# Altium project HP-85_IO_Extender_V2_4_Layer.PrjPcb
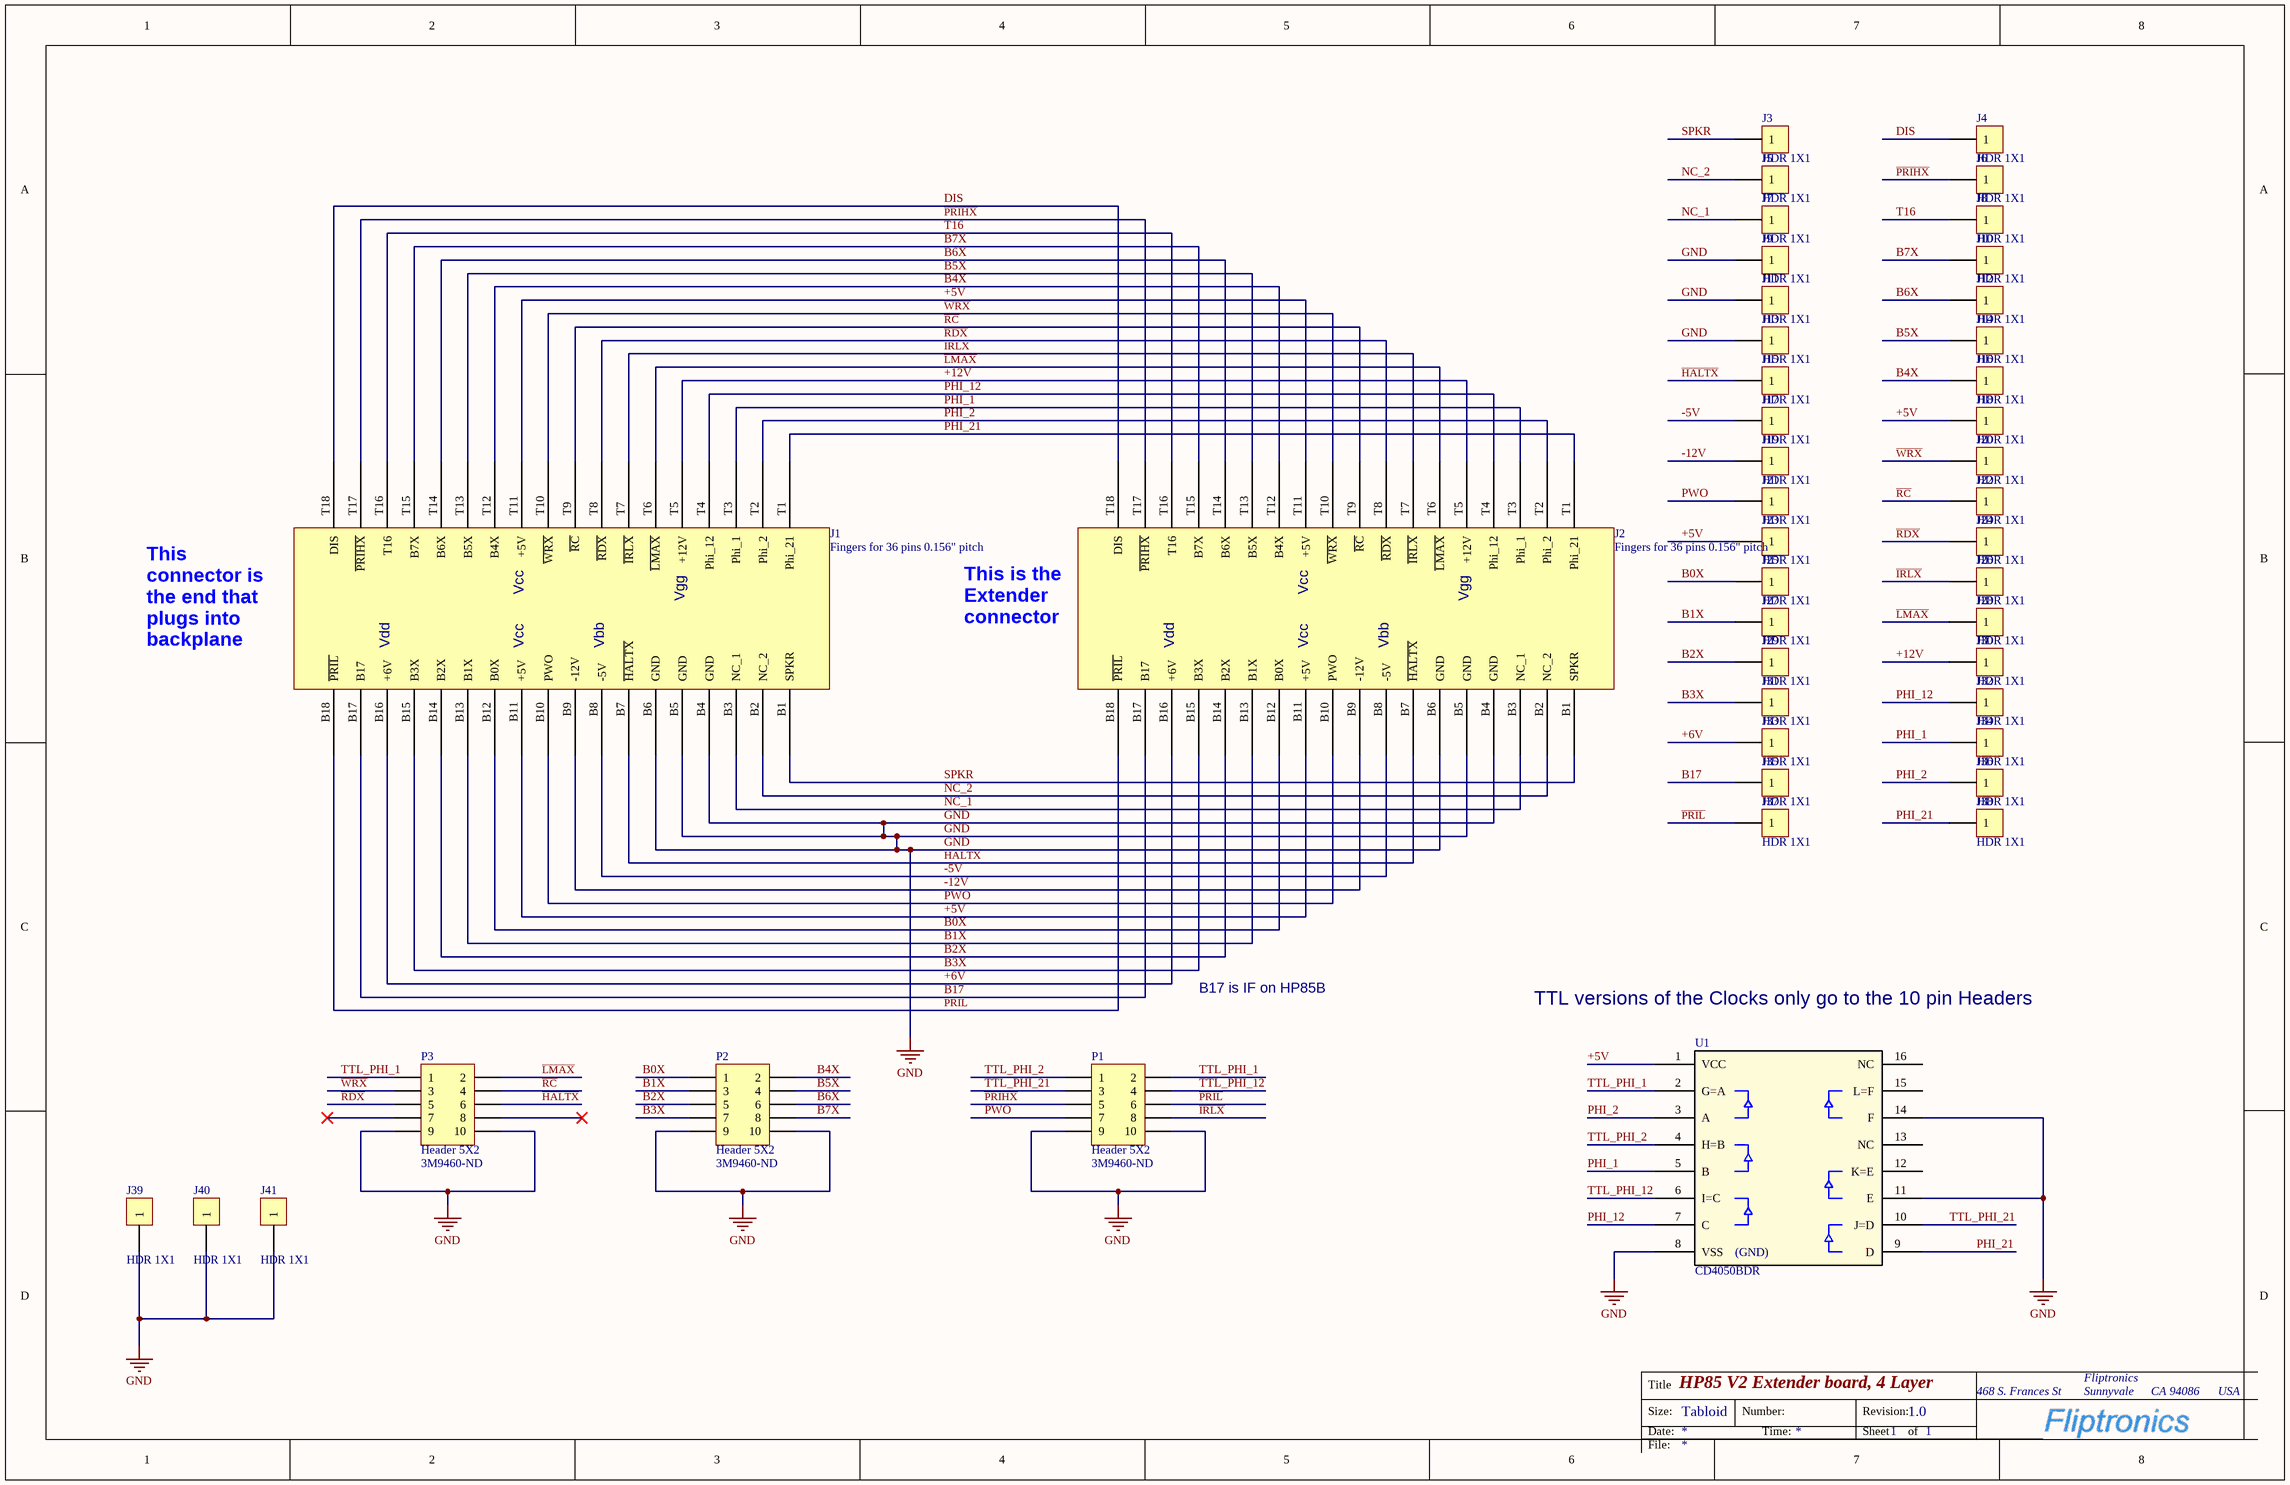
[diagram p0: HP-85_IO_Extender_V2_4_Layer.SchDoc]
1 sheet, 45 parts. Net scope: global (net labels, ports and power ports of the same name join across sheets).
Board file: HP-85_IO_Extender_V2_4_Layer.PcbDoc

## Sheet HP-85_IO_Extender_V2_4_Layer.SchDoc: HP85 V2 Extender board, 4 Layer
size Tabloid; ApprovedBy: Philip Freidin; CheckedBy: Philip Freidin; Author: Philip Freidin; Organization: Fliptronics; Address1: 468 S. Frances St; Address2: Sunnyvale; Address3: CA 94086; Address4: USA; Revision: 1.0; SheetNumber: 1; SheetTotal: 1

### Parts
J1  Fingers for 36 pins 0.156" pitch  [Fingers for 36 pins 0.156" pitch]
J2  Fingers for 36 pins 0.156" pitch  [Fingers for 36 pins 0.156" pitch]
J3  HDR 1X1  [HDR_1X1_2MM54_round]
J4  HDR 1X1  [HDR_1X1_2MM54_round]
J5  HDR 1X1  [HDR_1X1_2MM54_round]
J6  HDR 1X1  [HDR_1X1_2MM54_round]
J7  HDR 1X1  [HDR_1X1_2MM54_round]
J8  HDR 1X1  [HDR_1X1_2MM54_round]
J9  HDR 1X1  [HDR_1X1_2MM54_round]
J10  HDR 1X1  [HDR_1X1_2MM54_round]
J11  HDR 1X1  [HDR_1X1_2MM54_round]
J12  HDR 1X1  [HDR_1X1_2MM54_round]
J13  HDR 1X1  [HDR_1X1_2MM54_round]
J14  HDR 1X1  [HDR_1X1_2MM54_round]
J15  HDR 1X1  [HDR_1X1_2MM54_round]
J16  HDR 1X1  [HDR_1X1_2MM54_round]
J17  HDR 1X1  [HDR_1X1_2MM54_round]
J18  HDR 1X1  [HDR_1X1_2MM54_round]
J19  HDR 1X1  [HDR_1X1_2MM54_round]
J20  HDR 1X1  [HDR_1X1_2MM54_round]
J21  HDR 1X1  [HDR_1X1_2MM54_round]
J22  HDR 1X1  [HDR_1X1_2MM54_round]
J23  HDR 1X1  [HDR_1X1_2MM54_round]
J24  HDR 1X1  [HDR_1X1_2MM54_round]
J25  HDR 1X1  [HDR_1X1_2MM54_round]
J26  HDR 1X1  [HDR_1X1_2MM54_round]
J27  HDR 1X1  [HDR_1X1_2MM54_round]
J28  HDR 1X1  [HDR_1X1_2MM54_round]
J29  HDR 1X1  [HDR_1X1_2MM54_round]
J30  HDR 1X1  [HDR_1X1_2MM54_round]
J31  HDR 1X1  [HDR_1X1_2MM54_round]
J32  HDR 1X1  [HDR_1X1_2MM54_round]
J33  HDR 1X1  [HDR_1X1_2MM54_round]
J34  HDR 1X1  [HDR_1X1_2MM54_round]
J35  HDR 1X1  [HDR_1X1_2MM54_round]
J36  HDR 1X1  [HDR_1X1_2MM54_round]
J37  HDR 1X1  [HDR_1X1_2MM54_round]
J38  HDR 1X1  [HDR_1X1_2MM54_round]
J39  HDR 1X1  [HDR_1X1_2MM54_round]
J40  HDR 1X1  [HDR_1X1_2MM54_round]
J41  HDR 1X1  [HDR_1X1_2MM54_round]
P1  Header 5X2  Supplier Part Number 1: 3M9460-ND  [HDR_5X2 alt 1]
P2  Header 5X2  Supplier Part Number 1: 3M9460-ND  [HDR_5X2 alt 1]
P3  Header 5X2  Supplier Part Number 1: 3M9460-ND  [HDR_5X2 alt 1]
U1  CD4050BDR  [SOIC 16 W3.9mm P1.27mm]

### Nets
GND: J1.B4(GND) J1.B5(GND) J1.B6(GND) J2.B4(GND) J2.B5(GND) J2.B6(GND) J9.1 J11.1 J13.1 J39.1 J40.1 J41.1 P1.9 P1.10 P2.9 P2.10 P3.9 P3.10 U1.8(VSS) U1.11(E) U1.14(F)
+5V: J1.B11(+5V) J1.T11(+5V) J2.B11(+5V) J2.T11(+5V) J18.1 J23.1 U1.1(VCC)
+6V: J1.B16(+6V) J2.B16(+6V) J33.1
+12V: J1.T5(+12V) J2.T5(+12V) J30.1
-5V: J1.B8(-5V) J2.B8(-5V) J17.1
-12V: J1.B9(-12V) J2.B9(-12V) J19.1
~{HALTX}: J1.B7(~{HALTX}) J2.B7(~{HALTX}) J15.1 P3.6
~{IRLX}: J1.T7(~{IRLX}) J2.T7(~{IRLX}) J26.1 P1.8
~{LMAX}: J1.T6(~{LMAX}) J2.T6(~{LMAX}) J28.1 P3.2
~{PRIHX}: J1.T17(~{PRIHX}) J2.T17(~{PRIHX}) J6.1 P1.5
~{PRIL}: J1.B18(~{PRIL}) J2.B18(~{PRIL}) J37.1 P1.6
~{RC}: J1.T9(~{RC}) J2.T9(~{RC}) J22.1 P3.4
~{RDX}: J1.T8(~{RDX}) J2.T8(~{RDX}) J24.1 P3.5
~{WRX}: J1.T10(~{WRX}) J2.T10(~{WRX}) J20.1 P3.3
B0X: J1.B12(B0X) J2.B12(B0X) J25.1 P2.1
B1X: J1.B13(B1X) J2.B13(B1X) J27.1 P2.3
B2X: J1.B14(B2X) J2.B14(B2X) J29.1 P2.5
B3X: J1.B15(B3X) J2.B15(B3X) J31.1 P2.7
B4X: J1.T12(B4X) J2.T12(B4X) J16.1 P2.2
B5X: J1.T13(B5X) J2.T13(B5X) J14.1 P2.4
B6X: J1.T14(B6X) J2.T14(B6X) J12.1 P2.6
B7X: J1.T15(B7X) J2.T15(B7X) J10.1 P2.8
B17: J1.B17 J2.B17 J35.1
DIS: J1.T18(DIS) J2.T18(DIS) J4.1
NC_1: J1.B3(NC_1) J2.B3(NC_1) J7.1
NC_2: J1.B2(NC_2) J2.B2(NC_2) J5.1
PHI_1: J1.T3(Phi_1) J2.T3(Phi_1) J34.1 U1.5(B)
PHI_2: J1.T2(Phi_2) J2.T2(Phi_2) J36.1 U1.3(A)
PHI_12: J1.T4(Phi_12) J2.T4(Phi_12) J32.1 U1.7(C)
PHI_21: J1.T1(Phi_21) J2.T1(Phi_21) J38.1 U1.9(D)
PWO: J1.B10(PWO) J2.B10(PWO) J21.1 P1.7
SPKR: J1.B1(SPKR) J2.B1(SPKR) J3.1
T16: J1.T16 J2.T16 J8.1
TTL_PHI_1: P1.2 P3.1 U1.2(G=A)
TTL_PHI_2: P1.1 U1.4(H=B)
TTL_PHI_12: P1.4 U1.6(I=C)
TTL_PHI_21: P1.3 U1.10(J=D)

Not connected (* = marked no-connect by the designer): P3 7* 8*; U1 12(K=E) 13(NC) 15(L=F) 16(NC)

### Notes on the sheet
- This connector is the end that plugs into backplane
- (near J2) This is the  Extender connector
- B17 is IF on HP85B
- TTL versions of the Clocks only go to the 10 pin Headers
- Title
- Size:
- Date:
- Tabloid
- Number:
- Time:
- Revision:
- Sheet
- of
- File:
- (in symbol J Fingers for 36 pins 0.156" pitch for HP85) Vcc; Vgg; Vdd; Vbb
- (in symbol U CD4050BDR) (GND)

### Library data of the parts
J1 J2 = J Fingers for 36 pins 0.156" pitch for HP85: Fingers for 36 pins 0.156" pitch for HP85
J3-J41 = J Header 1X1: Header, 1-Pin; 1 MANUFACTURE A: Fliptronics; 1 MANUFACTURE A WEBSITE: ~; LatestRevisionDate: 2/11/2011; LatestRevisionNote: Created by PMF; Publisher: Fliptronics; 1 DISTRIBUTOR A: Fliptronics; 1 DISTRIBUTOR A ordering number: Philips Parts bin; 1 DISTRIBUTOR A price 1 off: 0.01; 1 DISTRIBUTOR A price 100 off: 0.01; 1 MANUFACTURE A PART NUMBER: Header 1X1; Supplier 1: Fliptronics; Supplier Part Number 1: Header 1X1; Supplier Stock 1: 20; Supplier Unit Price 1: 0.01
P1-P3 = J Header 5X2: Header, 5-Pin, Dual row; 1 MANUFACTURE A WEBSITE: ~; LatestRevisionDate: 17-Jul-2002; LatestRevisionNote: Re-released for DXP Platform.; Publisher: Altium Limited; Supplier 1: Digi-Key; 1 DISTRIBUTOR A: Digi-Key; 1 DISTRIBUTOR A ordering number: 3M9460-ND; 1 DISTRIBUTOR A price 1 off: 0.46; 1 DISTRIBUTOR A price 100 off: 0.336
U1 = U CD4050BDR: 48mA 1 3V~18V 8mA 6 SOP-16 Buffer/Driver/Transceiver ROHS; Manufacturer: Texas Instruments; Manufacturer Lifecycle Status: ACTIVE; High Level Output Current: -5.2mA; Logic Function: Buffer; Max Supply Voltage: 20V; Min Supply Voltage: -500mV; Number of Bits: 6; Number of Bits per Element: 1; Polarity: Non-Inverting; Propagation Delay: 60ns; Quiescent Current: 20µA; Turn-On Delay Time: 140ns; Supplier 1: DigiKey; Manufacturer Part Number: CD4050BDR; RoHS: Compliant; Category: Buffers, Drivers and Transceivers; Stock 1: 14885; Pricing 1: 1=0.65, 10=0.463, 25=0.4148, 100=0.3619, 250=0.33672, 500=0.32152, 1000=0.31463 (USD); Case/Package: SOIC; Contact Plating: Gold; Height: 1.75mm; Lead Free: Lead Free; Length: 9.9mm; Lifecycle Status: Production; Low Level Output Current: 8mA; Max Operating Temperature: 125°C; Min Operating Temperature: -55°C; Mount: Surface Mount; Number of Channels: 6; Number of Elements: 6; Number of Input Lines: 6; Number of Inputs: 6; Number of Output Lines: 6; Number of Outputs: 6; Number of Pins: 16; REACH SVHC: No; Schedule B: 8542390000, 8542390000|8542390000, 8542390000|8542390000|8542390000, 8542390000|8542390000|8542390000|8542390000; Thickness: 1.58mm; Width: 3.91mm; ComponentLink1URL: https://datasheet.octopart.com:443/CD4050BDR-Texas-Instruments-datasheet-27203525.pdf?src-supplier=Texas+Instruments; ComponentLink1Description: https://datasheet.octopart.com:443/CD4050BDR-Texas-Instruments-datasheet-27203525.pdf?src-supplier=Texas+Instruments; ComponentLink2URL: https://octopart.com:443/opatz8j6/c1?t=shVpaK6kaZhAvTquMlP1kBmJufYCgjIb7Ueuvqz-PnQIGf9tBCA2wmVZVeSwyNL0wzyf1zJ6cCOTEOJQq0X9BE7WZFlE6C07Lu1yrPRH_7pU960K83zF6yinbbCHbFuD_5RPOvEgQG4NC-UyO4eI_-JLm9EqoVbgrPpU-OW4hF6S15oXQIfFl2K9w9uWlKjIYejht7RtKTQToVbOn7eFDvn1ewvRfpT4TuhUbb8n15bolN7mi033KwD5LlF8ls95dB4PEoMTxflP_fiLEga3HBAg6_F-FWLajFotRU9aIDiCdH1EM8mIYNgu9aan6gZA_nC7nOERzDGX5uTal7J7VcnLExSN8lvBAblD4E7X5ipqS6VayOPvGHdeXsXJXIgW7ksw&src-supplier=Texas+Instruments; ComponentLink2Description: https://octopart.com:443/opatz8j6/c1?t=shVpaK6kaZhAvTquMlP1kBmJufYCgjIb7Ueuvqz-PnQIGf9tBCA2wmVZVeSwyNL0wzyf1zJ6cCOTEOJQq0X9BE7WZFlE6C07Lu1yrPRH_7pU960K83zF6yinbbCHbFuD_5RPOvEgQG4NC-UyO4eI_-JLm9EqoVbgrPpU-OW4hF6S15oXQIfFl2K9w9uWlKjIYejht7RtKTQToVbOn7eFDvn1ewvRfpT4TuhUbb8n15bolN7mi033KwD5LlF8ls95dB4PEoMTxflP_fiLEga3HBAg6_F-FWLajFotRU9aIDiCdH1EM8mIYNgu9aan6gZA_nC7nOERzDGX5uTal7J7VcnLExSN8lvBAblD4E7X5ipqS6VayOPvGHdeXsXJXIgW7ksw&src-supplier=Texas+Instruments; ComponentLink3URL: https://datasheet.octopart.com:443/CD4050BDR-Texas-Instruments-datasheet-10770490.pdf?src-supplier=Texas+Instruments; ComponentLink3Description: https://datasheet.octopart.com:443/CD4050BDR-Texas-Instruments-datasheet-10770490.pdf?src-supplier=Texas+Instruments; ComponentLink4URL: https://datasheet.octopart.com:443/CD4050BDR-Texas-Instruments-datasheet-10254678.pdf?src-supplier=Texas+Instruments; ComponentLink4Description: https://datasheet.octopart.com:443/CD4050BDR-Texas-Instruments-datasheet-10254678.pdf?src-supplier=Texas+Instruments; ComponentLink5URL: https://sigma.octopart.com:443/49249801/technical_drawing/Texas-Instruments-CD4050BDR.pdf?src-supplier=Texas+Instruments; ComponentLink5Description: https://sigma.octopart.com:443/49249801/technical_drawing/Texas-Instruments-CD4050BDR.pdf?src-supplier=Texas+Instruments; ComponentLink6URL: https://datasheet.octopart.com:443/CD4050BDR-Texas-Instruments-datasheet-148518.pdf?src-supplier=Texas+Instruments; ComponentLink6Description: https://datasheet.octopart.com:443/CD4050BDR-Texas-Instruments-datasheet-148518.pdf?src-supplier=Texas+Instruments; ComponentLink7URL: https://datasheet.octopart.com:443/CD4050BDR-Texas-Instruments-datasheet-10253518.pdf?src-supplier=Texas+Instruments; ComponentLink7Description: https://datasheet.octopart.com:443/CD4050BDR-Texas-Instruments-datasheet-10253518.pdf?src-supplier=Texas+Instruments; ComponentLink8URL: https://datasheet.octopart.com:443/CD4050BDR-Texas-Instruments-datasheet-47642703.pdf?src-supplier=Newark; ComponentLink8Description: https://datasheet.octopart.com:443/CD4050BDR-Texas-Instruments-datasheet-47642703.pdf?src-supplier=Newark; ComponentLink9URL: https://datasheet.octopart.com:443/CD4050BDR-Texas-Instruments-datasheet-21412919.pdf?src-supplier=Newark; ComponentLink9Description: https://datasheet.octopart.com:443/CD4050BDR-Texas-Instruments-datasheet-21412919.pdf?src-supplier=Newark; ComponentLink10URL: https://datasheet.octopart.com:443/CD4050BDR-Texas-Instruments-datasheet-11534345.pdf?src-supplier=Newark; ComponentLink10Description: https://datasheet.octopart.com:443/CD4050BDR-Texas-Instruments-datasheet-11534345.pdf?src-supplier=Newark; ComponentLink11URL: https://datasheet.octopart.com:443/CD4050BDR-Texas-Instruments-datasheet-164413289.pdf?src-supplier=SHENGYU+ELECTRONICS; ComponentLink11Description: https://datasheet.octopart.com:443/CD4050BDR-Texas-Instruments-datasheet-164413289.pdf?src-supplier=SHENGYU+ELECTRONICS; ComponentLink12URL: https://datasheet.octopart.com:443/CD4050BDR-Texas-Instruments-datasheet-159114768.pdf?src-supplier=LCSC; ComponentLink12Description: https://datasheet.octopart.com:443/CD4050BDR-Texas-Instruments-datasheet-159114768.pdf?src-supplier=LCSC; ComponentLink13URL: https://datasheet.octopart.com:443/CD4050BDR-Texas-Instruments-datasheet-14144724.pdf?src-supplier=iiiC; ComponentLink13Description: https://datasheet.octopart.com:443/CD4050BDR-Texas-Instruments-datasheet-14144724.pdf?src-supplier=iiiC; ComponentLink14URL: http://sigma.octopart.com:80/reach_statement/Texas-Instruments-company-64.pdf?src-supplier=Compliance+Statements; ComponentLink14Description: http://sigma.octopart.com:80/reach_statement/Texas-Instruments-company-64.pdf?src-supplier=Compliance+Statements; ComponentLink15URL: http://sigma.octopart.com:80/conflict_mineral_statement/Texas-Instruments-company-63.pdf?src-supplier=Compliance+Statements; ComponentLink15Description: http://sigma.octopart.com:80/conflict_mineral_statement/Texas-Instruments-company-63.pdf?src-supplier=Compliance+Statements; Supplier Part Number 1: 296-31503-1-ND